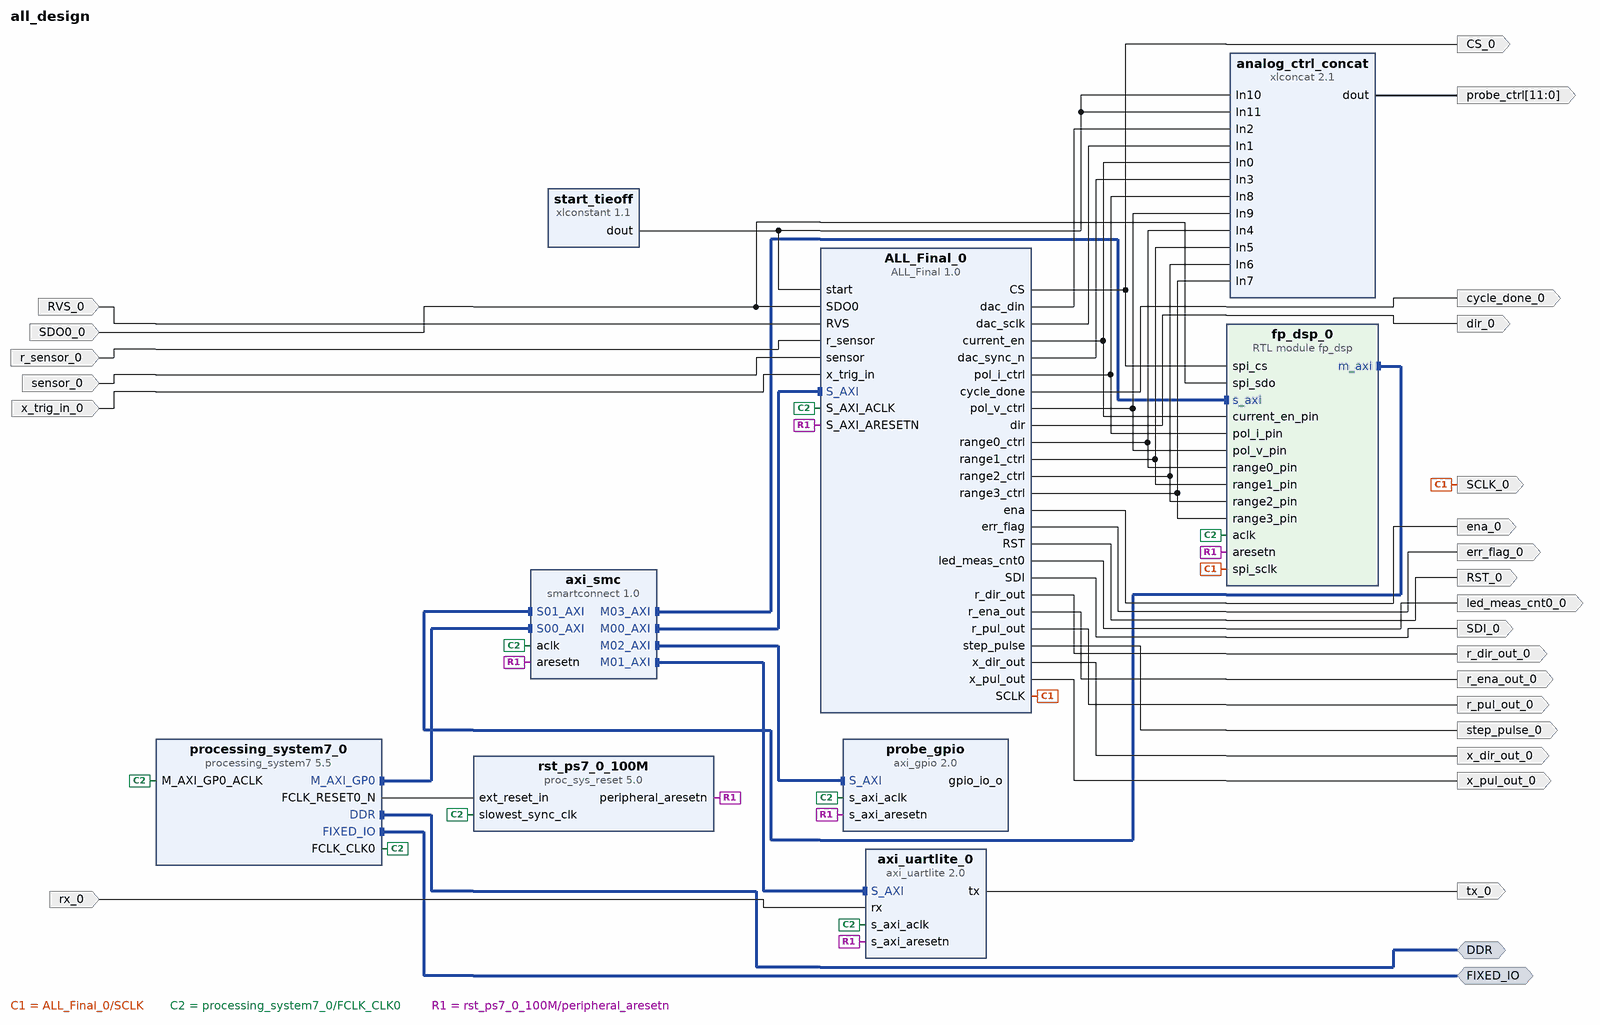
[diagram p0: block diagram of the top level]
# Vivado block design all_design, xc7z020clg400-1, Vivado 2026.1
create_bd_design all_design

create_bd_intf_port -mode Master -vlnv xilinx.com:interface:ddrx_rtl:1.0 DDR
create_bd_intf_port -mode Master -vlnv xilinx.com:display_processing_system7:fixedio_rtl:1.0 FIXED_IO
create_bd_port -dir O CS_0
create_bd_port -dir O -type rst RST_0
create_bd_port -dir I RVS_0
create_bd_port -dir O SCLK_0
create_bd_port -dir O SDI_0
create_bd_port -dir I SDO0_0
create_bd_port -dir O cycle_done_0
create_bd_port -dir O dir_0
create_bd_port -dir O ena_0
create_bd_port -dir O err_flag_0
create_bd_port -dir O led_meas_cnt0_0
create_bd_port -dir O r_dir_out_0
create_bd_port -dir O r_ena_out_0
create_bd_port -dir O r_pul_out_0
create_bd_port -dir I r_sensor_0
create_bd_port -dir I sensor_0
create_bd_port -dir O step_pulse_0
create_bd_port -dir O x_dir_out_0
create_bd_port -dir O x_pul_out_0
create_bd_port -dir I x_trig_in_0
create_bd_port -dir I rx_0
create_bd_port -dir O tx_0
create_bd_port -dir O -from 11 -to 0 probe_ctrl

create_bd_cell -type ip -vlnv xilinx.com:ip:processing_system7:5.5 processing_system7_0
set_property -dict [list \
  CONFIG.PCW_APU_PERIPHERAL_FREQMHZ 650 \
  CONFIG.PCW_CRYSTAL_PERIPHERAL_FREQMHZ 50 \
  CONFIG.PCW_ENET0_ENET0_IO {MIO 16 .. 27} \
  CONFIG.PCW_ENET0_GRP_MDIO_ENABLE 1 \
  CONFIG.PCW_ENET0_GRP_MDIO_IO {MIO 52 .. 53} \
  CONFIG.PCW_ENET0_PERIPHERAL_ENABLE 1 \
  CONFIG.PCW_ENET0_RESET_ENABLE 1 \
  CONFIG.PCW_ENET0_RESET_IO {MIO 9} \
  CONFIG.PCW_ENET_RESET_ENABLE 1 \
  CONFIG.PCW_ENET_RESET_SELECT {Share reset pin} \
  CONFIG.PCW_FPGA0_PERIPHERAL_FREQMHZ 50.000000 \
  CONFIG.PCW_FPGA1_PERIPHERAL_FREQMHZ 50 \
  CONFIG.PCW_GPIO_MIO_GPIO_ENABLE 1 \
  CONFIG.PCW_GPIO_MIO_GPIO_IO MIO \
  CONFIG.PCW_I2C_RESET_ENABLE 1 \
  CONFIG.PCW_PERIPHERAL_BOARD_PRESET part0 \
  CONFIG.PCW_PRESET_BANK1_VOLTAGE {LVCMOS 1.8V} \
  CONFIG.PCW_QSPI_GRP_FBCLK_ENABLE 1 \
  CONFIG.PCW_QSPI_GRP_FBCLK_IO {MIO 8} \
  CONFIG.PCW_QSPI_GRP_SINGLE_SS_ENABLE 1 \
  CONFIG.PCW_QSPI_GRP_SINGLE_SS_IO {MIO 1 .. 6} \
  CONFIG.PCW_QSPI_PERIPHERAL_ENABLE 1 \
  CONFIG.PCW_QSPI_QSPI_IO {MIO 1 .. 6} \
  CONFIG.PCW_SD0_GRP_CD_ENABLE 1 \
  CONFIG.PCW_SD0_GRP_CD_IO {MIO 47} \
  CONFIG.PCW_SD0_GRP_WP_ENABLE 0 \
  CONFIG.PCW_SD0_PERIPHERAL_ENABLE 1 \
  CONFIG.PCW_SD0_SD0_IO {MIO 40 .. 45} \
  CONFIG.PCW_SDIO_PERIPHERAL_FREQMHZ 50 \
  CONFIG.PCW_SINGLE_QSPI_DATA_MODE x4 \
  CONFIG.PCW_UART0_PERIPHERAL_ENABLE 1 \
  CONFIG.PCW_UART0_UART0_IO {MIO 14 .. 15} \
  CONFIG.PCW_UART1_PERIPHERAL_ENABLE 0 \
  CONFIG.PCW_UART_PERIPHERAL_FREQMHZ 100 \
  CONFIG.PCW_UIPARAM_DDR_BUS_WIDTH {16 Bit} \
  CONFIG.PCW_UIPARAM_DDR_FREQ_MHZ 525 \
  CONFIG.PCW_UIPARAM_DDR_PARTNO {MT41J256M16 RE-125} \
  CONFIG.PCW_USB0_PERIPHERAL_ENABLE 1 \
  CONFIG.PCW_USB0_RESET_ENABLE 1 \
  CONFIG.PCW_USB0_RESET_IO {MIO 46} \
  CONFIG.PCW_USB0_USB0_IO {MIO 28 .. 39} \
  CONFIG.PCW_USB_RESET_ENABLE 1 \
  CONFIG.PCW_USB_RESET_SELECT {Share reset pin} \
  CONFIG.preset None \
] [get_bd_cells processing_system7_0]
# 498 more settings of processing_system7_0 are not shown: defaults, MIO pin electricals, DDR timing, and values the tool derives
create_bd_cell -type ip -vlnv xilinx.com:ip:smartconnect:1.0 axi_smc
set_property -dict {CONFIG.NUM_MI 4 CONFIG.NUM_SI 2} [get_bd_cells axi_smc]
create_bd_cell -type ip -vlnv xilinx.com:ip:proc_sys_reset:5.0 rst_ps7_0_100M
create_bd_cell -type ip -vlnv xilinx.com:ip:axi_uartlite:2.0 axi_uartlite_0
set_property -dict {CONFIG.C_BAUDRATE 115200} [get_bd_cells axi_uartlite_0]
create_bd_cell -type ip -vlnv xilinx.com:ip:xlconstant:1.1 start_tieoff
set_property -dict {CONFIG.CONST_VAL 0 CONFIG.CONST_WIDTH 1} [get_bd_cells start_tieoff]
create_bd_cell -type ip -vlnv xilinx.com:ip:axi_gpio:2.0 probe_gpio
set_property -dict [list \
  CONFIG.C_ALL_OUTPUTS 1 \
  CONFIG.C_DOUT_DEFAULT 0x00000000 \
  CONFIG.C_GPIO_WIDTH 12 \
  CONFIG.C_INTERRUPT_PRESENT 0 \
] [get_bd_cells probe_gpio]
create_bd_cell -type ip -vlnv xilinx.com:ip:xlconcat:2.1 analog_ctrl_concat
set_property -dict {CONFIG.NUM_PORTS 12} [get_bd_cells analog_ctrl_concat]
create_bd_cell -type ip -vlnv xilinx.com:user:ALL_Final:1.0 ALL_Final_0
set_property -dict [list \
  CONFIG.ALARM_H_TH_REG 0x0024 \
  CONFIG.ALARM_L_TH_REG 0x0028 \
  CONFIG.ALARM_REG 0x0020 \
  CONFIG.BACK_FAIL_WAIT 500000 \
  CONFIG.BACK_MAX_STEP 20000 \
  CONFIG.BAUD 9600 \
  CONFIG.CALC_DIV10000_MUL {"01000"} \
  CONFIG.CALC_DIV10000_SHIFT {"01001"} \
  CONFIG.CALC_DIV1000_MUL {"00101"} \
  CONFIG.CALC_DIV1000_SHIFT {"00110"} \
  CONFIG.CALC_DIV100_MUL {"01011"} \
  CONFIG.CALC_DIV100_SHIFT {"01100"} \
  CONFIG.CALC_DIV10_MUL {"00010"} \
  CONFIG.CALC_DIV10_SHIFT {"00011"} \
  CONFIG.CALC_DONE {"10101"} \
  CONFIG.CALC_IDLE {"00000"} \
  CONFIG.CALC_MUL1 {"00001"} \
  CONFIG.CALC_MUL2 {"00100"} \
  CONFIG.CALC_MUL3 {"00111"} \
  CONFIG.CALC_MUL4 {"01010"} \
  CONFIG.CALC_RS_DIV100_MUL {"01110"} \
  CONFIG.CALC_RS_DIV100_SHIFT {"01111"} \
  CONFIG.CALC_RS_DONE {"10100"} \
  CONFIG.CALC_RS_MUL1 {"01101"} \
  CONFIG.CALC_RS_MUL2 {"10000"} \
  CONFIG.CALC_RS_MUL3 {"10001"} \
  CONFIG.CALC_RS_SHIFT_MUL {"10010"} \
  CONFIG.CALC_RS_SHIFT_SHIFT {"10011"} \
  CONFIG.CFG_Delay {"0001"} \
  CONFIG.CFG_Init {"0010"} \
  CONFIG.CFG_READ_DATA {"0100"} \
  CONFIG.CFG_READ_DONE {"0101"} \
  CONFIG.CFG_Reset {"0000"} \
  CONFIG.CFG_WAIT {"0011"} \
  CONFIG.CLK_FREQ 50000000 \
  CONFIG.CLOCK_FREQ 50000000 \
  CONFIG.CPHA {"0"} \
  CONFIG.CPOL {"0"} \
  CONFIG.DATAOUT_CTL_REG 0x0010 \
  CONFIG.DEVICE_ID_REG 0x0000 \
  CONFIG.DIR_SETUP_CNT 100 \
  CONFIG.HALF_LIFT_STEP 10000 \
  CONFIG.MCNT_BAUD 5207 \
  CONFIG.MCNT_BIT 9 \
  CONFIG.MCNT_DELAY 24999999 \
  CONFIG.MEAS_DELAY_50MS 2499999 \
  CONFIG.PAUSE_CLKS 250000000 \
  CONFIG.PULSE_HALF 500 \
  CONFIG.PULSE_PERIOD 1000 \
  CONFIG.RANGE_5120MV 0x0003 \
  CONFIG.RANGE_SEL_REG 0x0014 \
  CONFIG.READY_WAIT_CNT 10000 \
  CONFIG.RHO_DIV_1K 0x3E8 \
  CONFIG.RHO_FD 4532 \
  CONFIG.RHO_FSP 0x3E9 \
  CONFIG.RHO_FW 1050 \
  CONFIG.RST_PWRCTL_REG 0x0004 \
  CONFIG.SDI_CTL_REG 0x0008 \
  CONFIG.SDO_CTL_REG 0x000C \
  CONFIG.SEN_DELAY_CNT 50000 \
  CONFIG.SLOW_DIV 6 \
  CONFIG.SPI_DATA_WIDTH 32 \
  CONFIG.SPI_IDLE {"00"} \
  CONFIG.SPI_START_TX {"01"} \
  CONFIG.SPI_S_FINISH {"11"} \
  CONFIG.SPI_S_IDLE {"00"} \
  CONFIG.SPI_S_PREPARE {"01"} \
  CONFIG.SPI_S_TRANSFER {"10"} \
  CONFIG.SPI_WAIT_DONE {"10"} \
  CONFIG.STEPS_FORWARD 37850 \
  CONFIG.S_ERR {"10001"} \
  CONFIG.S_IDLE {"00000"} \
  CONFIG.S_M2_BACK {"10000"} \
  CONFIG.S_M2_DIR1 {"01001"} \
  CONFIG.S_M2_DIR2 {"01100"} \
  CONFIG.S_M2_DIR3 {"01111"} \
  CONFIG.S_M2_FINAL_ROT {"10010"} \
  CONFIG.S_M2_GO1 {"00111"} \
  CONFIG.S_M2_GO2 {"01101"} \
  CONFIG.S_M2_LIFT_HALF {"01010"} \
  CONFIG.S_M2_PAUSE1 {"01000"} \
  CONFIG.S_M2_PAUSE2 {"01110"} \
  CONFIG.S_M2_WAIT_ROT {"01011"} \
  CONFIG.S_MODE1_BACK {"00110"} \
  CONFIG.S_MODE1_DIR {"00101"} \
  CONFIG.S_MODE1_GO {"00011"} \
  CONFIG.S_MODE1_PAUSE {"00100"} \
  CONFIG.S_PWR_HOME {"00001"} \
  CONFIG.S_READY {"00010"} \
  CONFIG.TOTAL_CHAR 785 \
  CONFIG.UART_IDLE 0 \
  CONFIG.UART_NEXT 3 \
  CONFIG.UART_SEND 1 \
  CONFIG.UART_WAIT 2 \
  CONFIG.WAIT_CYCLE 58000 \
  CONFIG.W_mm 645 \
  CONFIG.sel_doping 1 \
  CONFIG.sel_sample 1 \
  CONFIG.x_DEBOUNCE_CNT 500000 \
  CONFIG.x_HALF_PERIOD 25000 \
  CONFIG.x_PUL_FREQ 1000 \
  CONFIG.x_PUL_NUM 3000 \
  CONFIG.x_SYS_FREQ 50000000 \
] [get_bd_cells ALL_Final_0]
create_bd_cell -type module -reference fp_dsp fp_dsp_0

# ---- connections ----

connect_bd_intf_net [get_bd_intf_pins axi_smc/M00_AXI] [get_bd_intf_pins ALL_Final_0/S_AXI]
connect_bd_intf_net [get_bd_intf_pins axi_smc/M01_AXI] [get_bd_intf_pins axi_uartlite_0/S_AXI]
connect_bd_intf_net [get_bd_intf_pins axi_smc/M02_AXI] [get_bd_intf_pins probe_gpio/S_AXI]
connect_bd_intf_net [get_bd_intf_pins axi_smc/M03_AXI] [get_bd_intf_pins fp_dsp_0/s_axi]
connect_bd_intf_net [get_bd_intf_pins fp_dsp_0/m_axi] [get_bd_intf_pins axi_smc/S01_AXI]
connect_bd_intf_net [get_bd_intf_ports DDR] [get_bd_intf_pins processing_system7_0/DDR]
connect_bd_intf_net [get_bd_intf_ports FIXED_IO] [get_bd_intf_pins processing_system7_0/FIXED_IO]
connect_bd_intf_net [get_bd_intf_pins processing_system7_0/M_AXI_GP0] [get_bd_intf_pins axi_smc/S00_AXI]
connect_bd_net [get_bd_pins ALL_Final_0/CS] [get_bd_ports CS_0] [get_bd_pins fp_dsp_0/spi_cs]
connect_bd_net [get_bd_pins ALL_Final_0/RST] [get_bd_ports RST_0]
connect_bd_net [get_bd_pins ALL_Final_0/SCLK] [get_bd_ports SCLK_0] [get_bd_pins fp_dsp_0/spi_sclk]
connect_bd_net [get_bd_pins ALL_Final_0/SDI] [get_bd_ports SDI_0]
connect_bd_net [get_bd_pins ALL_Final_0/current_en] [get_bd_pins analog_ctrl_concat/In0] [get_bd_pins fp_dsp_0/current_en_pin]
connect_bd_net [get_bd_pins ALL_Final_0/cycle_done] [get_bd_ports cycle_done_0]
connect_bd_net [get_bd_pins ALL_Final_0/dac_din] [get_bd_pins analog_ctrl_concat/In2]
connect_bd_net [get_bd_pins ALL_Final_0/dac_sclk] [get_bd_pins analog_ctrl_concat/In1]
connect_bd_net [get_bd_pins ALL_Final_0/dac_sync_n] [get_bd_pins analog_ctrl_concat/In3]
connect_bd_net [get_bd_pins ALL_Final_0/dir] [get_bd_ports dir_0]
connect_bd_net [get_bd_pins ALL_Final_0/ena] [get_bd_ports ena_0]
connect_bd_net [get_bd_pins ALL_Final_0/err_flag] [get_bd_ports err_flag_0]
connect_bd_net [get_bd_pins ALL_Final_0/led_meas_cnt0] [get_bd_ports led_meas_cnt0_0]
connect_bd_net [get_bd_pins ALL_Final_0/pol_i_ctrl] [get_bd_pins analog_ctrl_concat/In8] [get_bd_pins fp_dsp_0/pol_i_pin]
connect_bd_net [get_bd_pins ALL_Final_0/pol_v_ctrl] [get_bd_pins analog_ctrl_concat/In9] [get_bd_pins fp_dsp_0/pol_v_pin]
connect_bd_net [get_bd_pins ALL_Final_0/r_dir_out] [get_bd_ports r_dir_out_0]
connect_bd_net [get_bd_pins ALL_Final_0/r_ena_out] [get_bd_ports r_ena_out_0]
connect_bd_net [get_bd_pins ALL_Final_0/r_pul_out] [get_bd_ports r_pul_out_0]
connect_bd_net [get_bd_pins ALL_Final_0/range0_ctrl] [get_bd_pins analog_ctrl_concat/In4] [get_bd_pins fp_dsp_0/range0_pin]
connect_bd_net [get_bd_pins ALL_Final_0/range1_ctrl] [get_bd_pins analog_ctrl_concat/In5] [get_bd_pins fp_dsp_0/range1_pin]
connect_bd_net [get_bd_pins ALL_Final_0/range2_ctrl] [get_bd_pins analog_ctrl_concat/In6] [get_bd_pins fp_dsp_0/range2_pin]
connect_bd_net [get_bd_pins ALL_Final_0/range3_ctrl] [get_bd_pins analog_ctrl_concat/In7] [get_bd_pins fp_dsp_0/range3_pin]
connect_bd_net [get_bd_pins ALL_Final_0/step_pulse] [get_bd_ports step_pulse_0]
connect_bd_net [get_bd_pins ALL_Final_0/x_dir_out] [get_bd_ports x_dir_out_0]
connect_bd_net [get_bd_pins ALL_Final_0/x_pul_out] [get_bd_ports x_pul_out_0]
connect_bd_net -net RVS_0_1 [get_bd_ports RVS_0] [get_bd_pins ALL_Final_0/RVS]
connect_bd_net -net SDO0_0_1 [get_bd_ports SDO0_0] [get_bd_pins ALL_Final_0/SDO0] [get_bd_pins fp_dsp_0/spi_sdo]
connect_bd_net [get_bd_pins analog_ctrl_concat/dout] [get_bd_ports probe_ctrl]
connect_bd_net [get_bd_pins axi_uartlite_0/tx] [get_bd_ports tx_0]
# net probe_gpio_gpio_io_o has one end: probe_gpio/gpio_io_o
connect_bd_net [get_bd_pins processing_system7_0/FCLK_CLK0] \
  [get_bd_pins processing_system7_0/M_AXI_GP0_ACLK] [get_bd_pins axi_smc/aclk] [get_bd_pins rst_ps7_0_100M/slowest_sync_clk] \
  [get_bd_pins axi_uartlite_0/s_axi_aclk] [get_bd_pins probe_gpio/s_axi_aclk] [get_bd_pins ALL_Final_0/S_AXI_ACLK] \
  [get_bd_pins fp_dsp_0/aclk]
connect_bd_net [get_bd_pins processing_system7_0/FCLK_RESET0_N] [get_bd_pins rst_ps7_0_100M/ext_reset_in]
connect_bd_net -net r_sensor_0_1 [get_bd_ports r_sensor_0] [get_bd_pins ALL_Final_0/r_sensor]
connect_bd_net [get_bd_pins rst_ps7_0_100M/peripheral_aresetn] \
  [get_bd_pins axi_smc/aresetn] [get_bd_pins axi_uartlite_0/s_axi_aresetn] [get_bd_pins probe_gpio/s_axi_aresetn] \
  [get_bd_pins ALL_Final_0/S_AXI_ARESETN] [get_bd_pins fp_dsp_0/aresetn]
connect_bd_net -net rx_0_1 [get_bd_ports rx_0] [get_bd_pins axi_uartlite_0/rx]
connect_bd_net -net sensor_0_1 [get_bd_ports sensor_0] [get_bd_pins ALL_Final_0/sensor]
connect_bd_net [get_bd_pins start_tieoff/dout] \
  [get_bd_pins analog_ctrl_concat/In10] [get_bd_pins analog_ctrl_concat/In11] [get_bd_pins ALL_Final_0/start]
connect_bd_net -net x_trig_in_0_1 [get_bd_ports x_trig_in_0] [get_bd_pins ALL_Final_0/x_trig_in]

# ---- address map ----
assign_bd_address -offset 0x40000000 -range 64K -target_address_space [get_bd_addr_spaces fp_dsp_0/m_axi] [get_bd_addr_segs ALL_Final_0/S_AXI/reg0]
exclude_bd_addr_seg -offset 0x00000000 -range 1 -target_address_space [get_bd_addr_spaces fp_dsp_0/m_axi] [get_bd_addr_segs axi_uartlite_0/S_AXI/Reg]
exclude_bd_addr_seg -offset 0x00000000 -range 1 -target_address_space [get_bd_addr_spaces fp_dsp_0/m_axi] [get_bd_addr_segs fp_dsp_0/s_axi/reg0]
exclude_bd_addr_seg -offset 0x00000000 -range 1 -target_address_space [get_bd_addr_spaces fp_dsp_0/m_axi] [get_bd_addr_segs probe_gpio/S_AXI/Reg]
assign_bd_address -offset 0x40000000 -range 64K -target_address_space [get_bd_addr_spaces processing_system7_0/Data] [get_bd_addr_segs ALL_Final_0/S_AXI/reg0]
assign_bd_address -offset 0x42C00000 -range 64K -target_address_space [get_bd_addr_spaces processing_system7_0/Data] [get_bd_addr_segs axi_uartlite_0/S_AXI/Reg]
assign_bd_address -offset 0x43C00000 -range 64K -target_address_space [get_bd_addr_spaces processing_system7_0/Data] [get_bd_addr_segs probe_gpio/S_AXI/Reg]
assign_bd_address -offset 0x43C10000 -range 64K -target_address_space [get_bd_addr_spaces processing_system7_0/Data] [get_bd_addr_segs fp_dsp_0/s_axi/reg0]

validate_bd_design
save_bd_design
